# EAGLE design source_eagle (EAGLE 6.6.0)
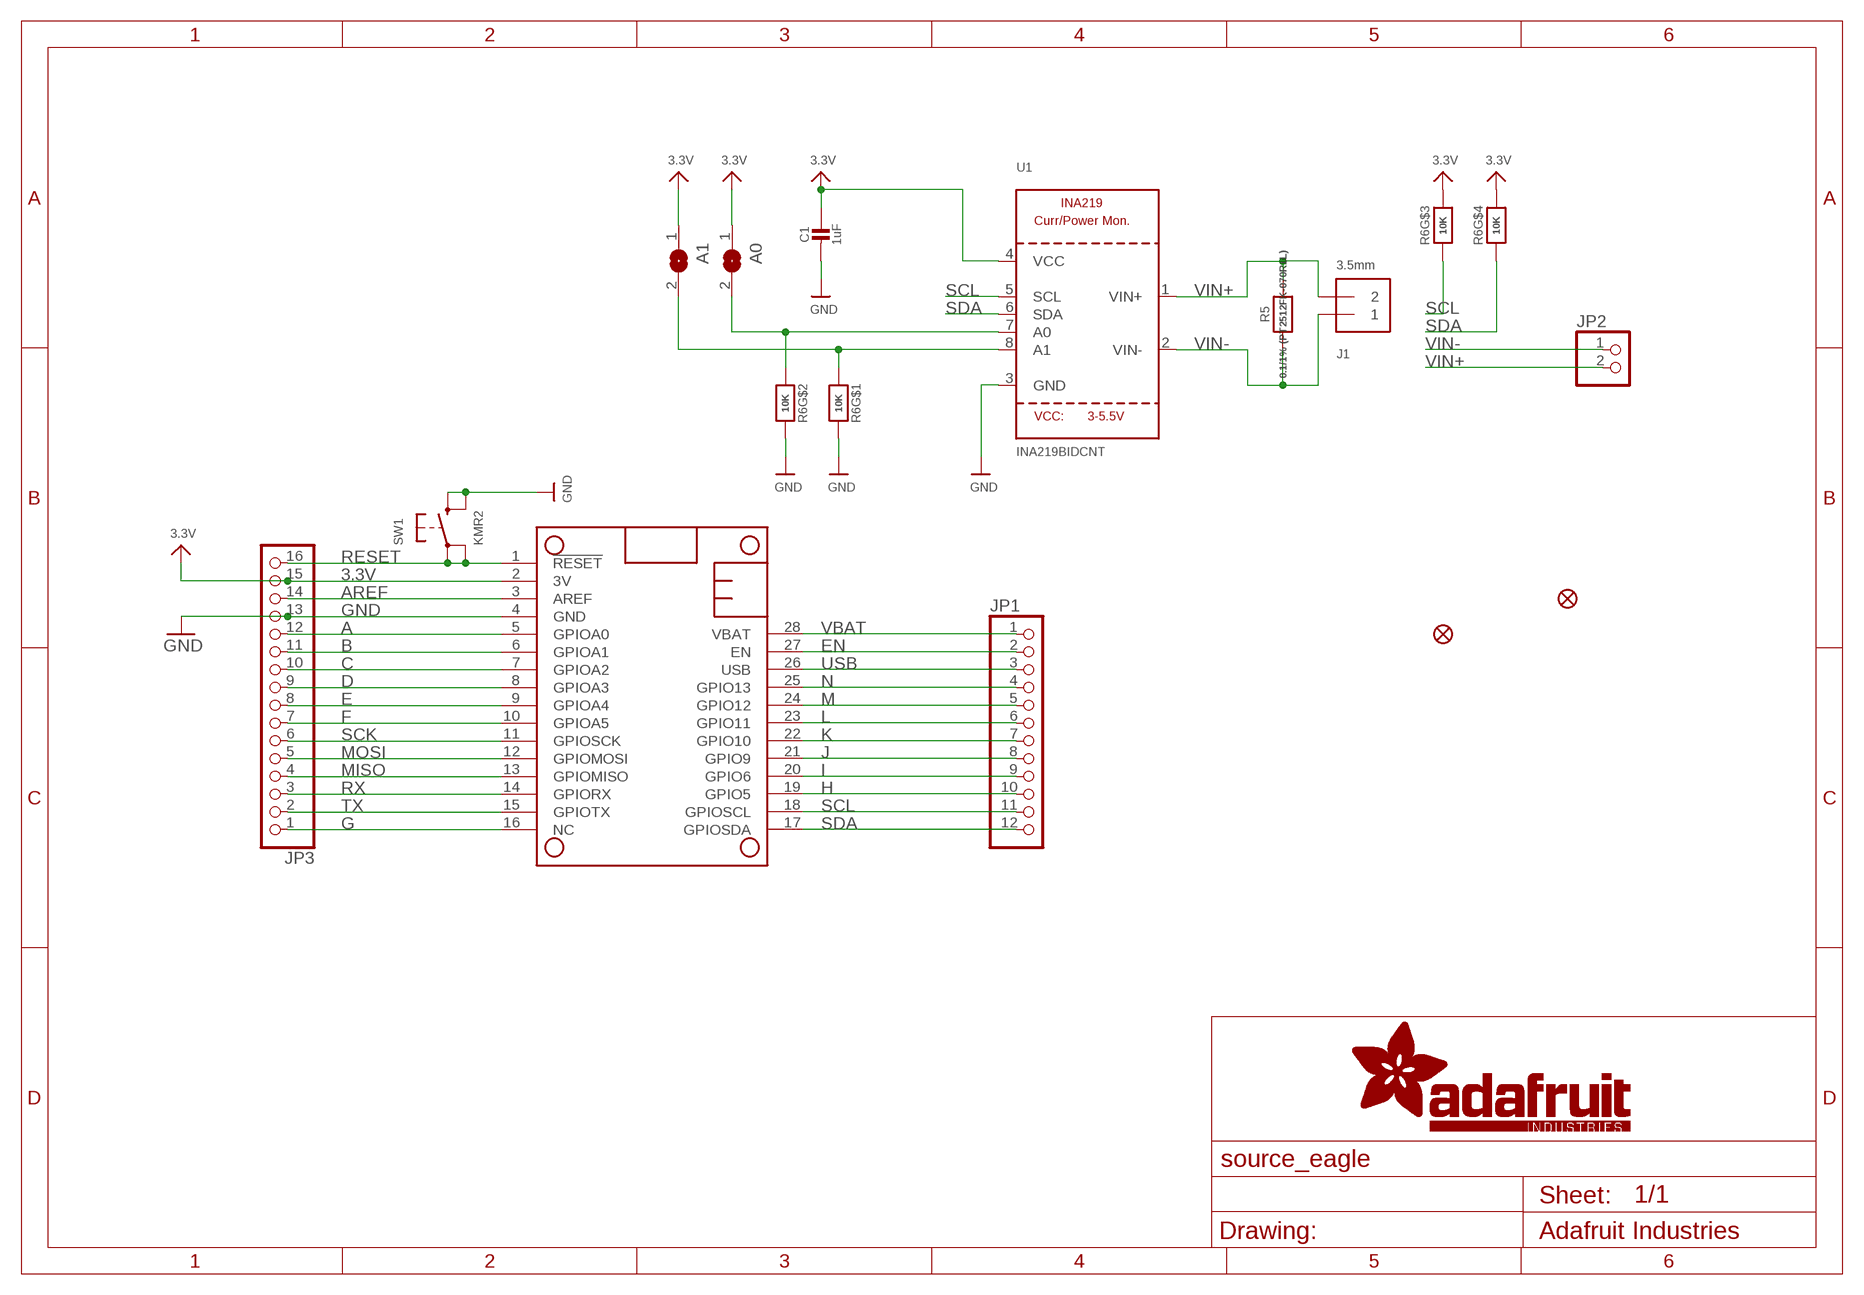
[diagram p0: schematic, sheet 1]

## Parts
A0  SOLDERJUMPERREFLOW_NOPASTE  [SOLDERJUMPER_REFLOW_NOPASTE]
A1  SOLDERJUMPERREFLOW_NOPASTE  [SOLDERJUMPER_REFLOW_NOPASTE]
C1  1uF  CAP_CERAMIC0805-NOOUTLINE  [0805-NO@1]
FID1  FIDUCIAL_1MM  [FIDUCIAL_1MM]
FID2  FIDUCIAL_1MM  [FIDUCIAL_1MM]
J1  3.5mm  TERMBLOCK_1X2  [TERMBLOCK_1X2-3.5MM]
JP1  HEADER-1X1276MIL  [1X12_ROUND_76MIL]
JP2  HEADER-1X2ROUND  [1X02_ROUND]
JP3  HEADER-1X16_76MIL  [1X16_ROUND_76MIL]
MS1  FEATHERWING  [FEATHERWING]
R5  0.1/1% (PT2512FK-070R1L)  RESISTOR2512  [2512]
R6  10K  RESISTOR_4PACK  [RESPACK_4X0603]
SW1  KMR2  SWITCH_TACT_SMT4.6X2.8  [BTN_KMR2_4.6X2.8]
U1  INA219BIDCNT  INA219  [SOT23-8]

## Nets
3.3V: A0.1 A1.1 C1.1 JP3.15 MS1.2(3V) R6.5 R6.6 U1.4(VCC)
A: JP3.12 MS1.5(GPIOA0)
AREF: JP3.14 MS1.3(AREF)
B: JP3.11 MS1.6(GPIOA1)
C: JP3.10 MS1.7(GPIOA2)
D: JP3.9 MS1.8(GPIOA3)
E: JP3.8 MS1.9(GPIOA4)
EN: JP1.2 MS1.27(EN)
F: JP3.7 MS1.10(GPIOA5)
G: JP3.1 MS1.16(NC)
GND: C1.2 JP3.13 MS1.4(GND) R6.7 R6.8 SW1.B'(S1) SW1.B(S) U1.3(GND)
H: JP1.10 MS1.19(GPIO5)
I: JP1.9 MS1.20(GPIO6)
J: JP1.8 MS1.21(GPIO9)
K: JP1.7 MS1.22(GPIO10)
L: JP1.6 MS1.23(GPIO11)
M: JP1.5 MS1.24(GPIO12)
MISO: JP3.4 MS1.13(GPIOMISO)
MOSI: JP3.5 MS1.12(GPIOMOSI)
N: JP1.4 MS1.25(GPIO13)
N$1: A1.2 R6.1 U1.8(A1)
N$2: A0.2 R6.2 U1.7(A0)
RESET: JP3.16 MS1.1(!RESET) SW1.A'(P1) SW1.A(P)
RX: JP3.3 MS1.14(GPIORX)
SCK: JP3.6 MS1.11(GPIOSCK)
SCL: JP1.11 MS1.18(GPIOSCL) R6.3 U1.5(SCL)
SDA: JP1.12 MS1.17(GPIOSDA) R6.4 U1.6(SDA)
TX: JP3.2 MS1.15(GPIOTX)
USB: JP1.3 MS1.26(USB)
VBAT: JP1.1 MS1.28(VBAT)
VIN+: J1.2 JP2.2 R5.2 U1.1(VIN+)
VIN-: J1.1 JP2.1 R5.1 U1.2(VIN-)

## Library data of the parts
A0 A1 = microbuilder:SOLDERJUMPER: SMD Solder JUMPER Solder the two pads together to create a connection, or remove the solder to break it. REFLOW - Use this footprint for solder paste and reflow ovens. WAVE - Use this footprint for hand-soldering (larger pads). CLOSED - Has a trace between the two pads to ensure it is closed by default. The trace needs to be cut to disable the jumper, and can be closed again by creating a solder bridge between the two pads.
C1 = microbuilder:CAP_CERAMIC: Ceramic Capacitors For new designs, use the packages preceded by an '_' character since they are more reliable: The following footprints should be used on most boards: _0402 - Standard footprint for regular board layouts _0603 - Standard footprint for regular board layouts _0805 - Standard footprint for regular board layouts _1206 - Standard footprint for regular board layouts For extremely tight-pitch boards where space is at a premium, the following 'micro-pitch' footprints can be used (smaller pads, no silkscreen outline, etc.): _0402MP - Micro-pitch footprint for very dense/compact boards _0603MP - Micro-pitch footprint for very dense/compact boards _0805MP - Micro-pitch footprint for very dense/compact boards _1206MP - Micro-pitch footprint for very dense/compact boards
FID1 FID2 = microbuilder:FIDUCIAL: Fiducial Alignment Points Various fiducial points for machine vision alignment.; BOM: EXCLUDE
J1 = microbuilder:TERMBLOCK_1X2: 3.5mm Terminal block http://www.ladyada.net/library/pcb/eaglelibrary.html
JP1 = microbuilder:HEADER-1X12
JP2 = microbuilder:HEADER-1X2: PIN HEADER
JP3 = microbuilder:HEADER-1X16: PIN HEADER
MS1 = microbuilder:FEATHERWING
R5 = microbuilder:RESISTOR: Resistors For new designs, use the packages preceded by an '_' character since they are more reliable: The following footprints should be used on most boards: _0402 - Standard footprint for regular board layouts _0603 - Standard footprint for regular board layouts _0805 - Standard footprint for regular board layouts _1206 - Standard footprint for regular board layouts For extremely tight-pitch boards where space is at a premium, the following 'micro-pitch' footprints can be used (smaller pads, no silkscreen outline, etc.): _0402MP - Micro-pitch footprint for very dense/compact boards _0603MP - Micro-pitch footprint for very dense/compact boards _0805MP - Micro-pitch footprint for very dense/compact boards _1206MP - Micro-pitch footprint for very dense/compact boards
R6 = microbuilder:RESISTOR_4PACK: Resistor Packs (4 resistors) 4 x 0603 10K 1/16W - Digikey: YC164J-10KCT-ND
SW1 = microbuilder:SWITCH_TACT_SMT: SMT Tact Switches 6x6mm - Digikey: P12940SCT-ND KMR2 (4.6x2.8mm) - Digikey: 401-1426-1-ND EVQ-PQHB55 - Light Touch, 160GF (4.5x4.5mm) - Digikey: P8090SCT-ND KMT0 - KMT021 NGJ LHS (etc.) IP68/Waterproof - Digikey: CKN10289CT-ND
U1 = microbuilder:INA219: INA219 - I2C Current/Power Monitor Voltage Range: 0-26V Accuracy: 0.5% Temperature: -40°C - 125°C

## Board
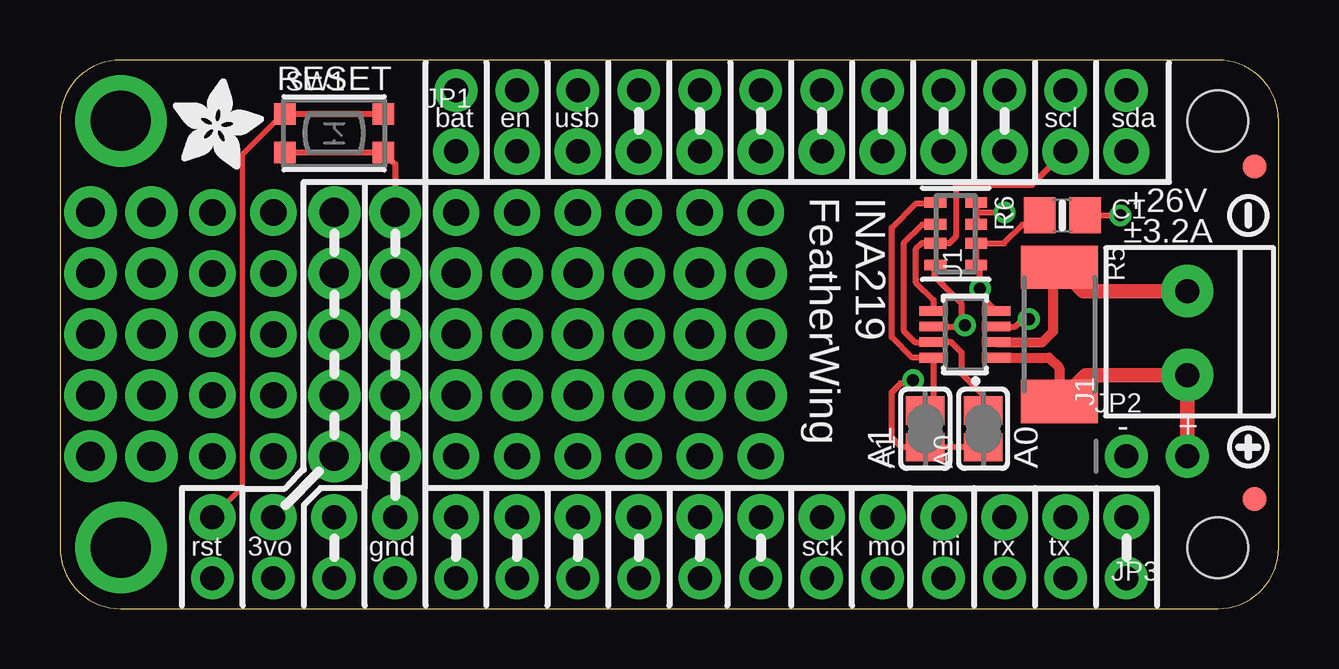
[diagram p1: board, top side]
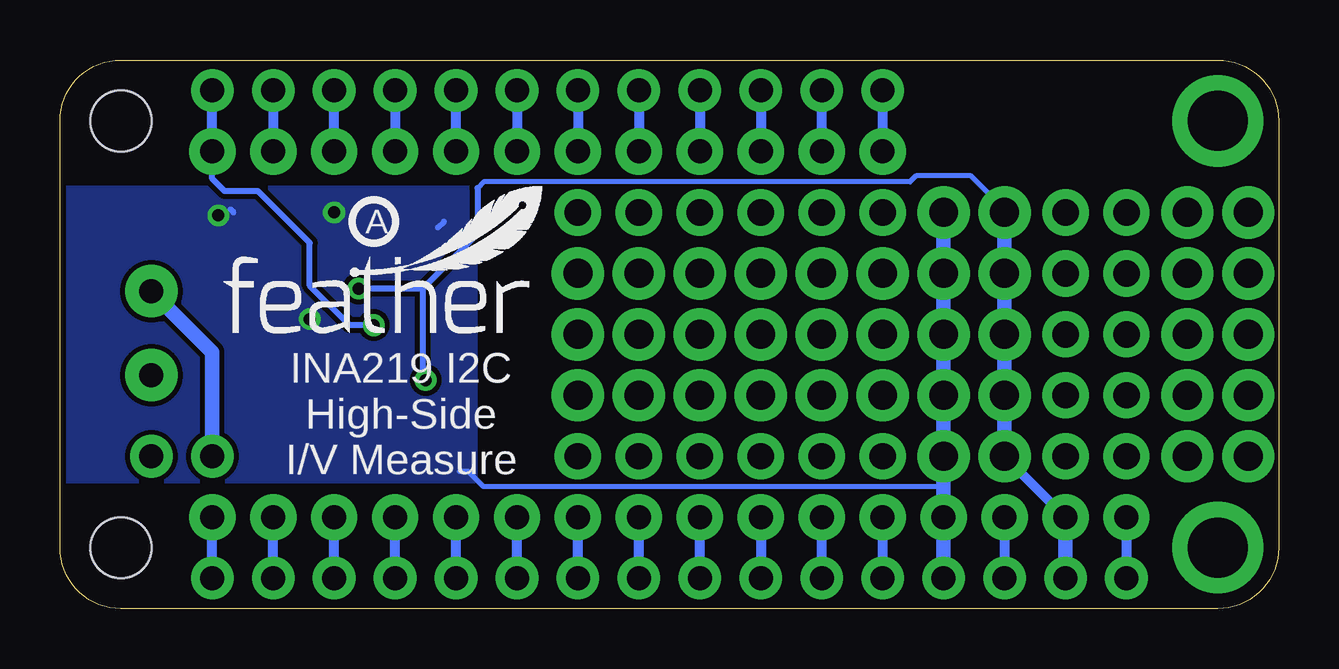
[diagram p2: board, bottom side, seen from below]

Size 50.8 x 22.86 mm. Coordinates in mm from the lower left corner, seen from the top.
Copper layers (1*16): Top 0.035mm / dielectric 1.5mm / Bottom 0.035mm
Design rules "adafruit *": minimum track width 8mil, minimum drill 15.5mil, track to track 8mil, track to pad 8mil, pad to pad 8mil, via to via 8mil, smd to smd 8mil, copper to edge 10mil, drill to drill 8mil, minimum pad ring 10mil, minimum via ring 8mil, stop-mask expansion 2mil, vias tented up to drill 20mil, thermal gap 10mil

### Footprints (pad centres in the part's own frame; a part is rotated, then mirrored left to right if it is on the bottom)
SOLDERJUMPER_REFLOW_NOPASTE = smd 1.168 x 1.6: 1 -0.762,0; 2 0.762,0
0805-NO@1 = smd 1.3 x 1.5: 1 -0.95,0; 2 0.95,0
FIDUCIAL_1MM = smd 1 x 1: 1 0,0
TERMBLOCK_1X2-3.5MM = drill 1 pad 2.184: 1 1.8,0; 2 -1.7,0
1X12_ROUND_76MIL = drill 1 pad 1.93: 1 -13.97,0; 2 -11.43,0; 3 -8.89,0; 4 -6.35,0; 5 -3.81,0; 6 -1.27,0; 7 1.27,0; 8 3.81,0; 9 6.35,0; 10 8.89,0; 11 11.43,0; 12 13.97,0
1X02_ROUND = drill 1 pad 1.778: 1 -1.27,0; 2 1.27,0
1X16_ROUND_76MIL = drill 1 pad 1.93: 1 -19.05,0; 2 -16.51,0; 3 -13.97,0; 4 -11.43,0; 5 -8.89,0; 6 -6.35,0; 7 -3.81,0; 8 -1.27,0; 9 1.27,0; 10 3.81,0; 11 6.35,0; 12 8.89,0; 13 11.43,0; 14 13.97,0; 15 16.51,0; 16 19.05,0
FEATHERWING = drill 1 pad 1.778: 1 6.35,1.27; 2 8.89,1.27; 3 11.43,1.27; 4 13.97,1.27; 5 16.51,1.27; 6 19.05,1.27; 7 21.59,1.27; 8 24.13,1.27; 9 26.67,1.27; 10 29.21,1.27; 11 31.75,1.27; 12 34.29,1.27; 13 36.83,1.27; 14 39.37,1.27; 15 41.91,1.27; 16 44.45,1.27; 17 44.45,21.59; 18 41.91,21.59; 19 39.37,21.59; 20 36.83,21.59; 21 34.29,21.59; 22 31.75,21.59; 23 29.21,21.59; 24 26.67,21.59; 25 24.13,21.59; 26 21.59,21.59; 27 19.05,21.59; 28 16.51,21.59 | drill 2.5 pad 3.81: P$1 2.54,20.32; P$2 2.54,2.54 | hole 2.54: 48.26,20.32; 48.26,2.54
2512 = smd 1.8 x 3.2: 1 -2.8,0; 2 2.8,0
RESPACK_4X0603 = smd 0.45 x 0.9: 1 -1.3,-0.85; 2 -0.4,-0.85; 3 0.4,-0.85; 4 1.3,-0.85; 5 1.3,0.85; 6 0.4,0.85; 7 -0.4,0.85; 8 -1.3,0.85
BTN_KMR2_4.6X2.8 = smd 0.9 x 0.9: A 2.05,0.8; A' -2.05,0.8; B 2.05,-0.8; B' -2.05,-0.8
SOT23-8 = smd 0.4 x 1.2: 1 -0.975,-1.3; 2 -0.325,-1.3; 3 0.325,-1.3; 4 0.975,-1.3; 5 0.975,1.3; 6 0.325,1.3; 7 -0.325,1.3; 8 -0.975,1.3

### Placement (x,y rotation side)
A0  38.48,7.49 90 top
A1  36.07,7.49 90 top
C1  41.78,16.38 0 top
FID1  49.78,4.57 0 top
FID2  49.78,18.41 0 top
J1  46.99,11.43 90 top
JP1  30.48,19.05 0 top
JP2  45.72,6.35 0 top
JP3  25.4,3.81 180 top
MS1  0,0 0 top
R5  41.66,11.43 270 top
R6  37.34,15.62 270 top
SW1  11.43,19.81 0 top
U1  37.72,11.43 90 top
U$12  [SYMBOL_PLUS]  49.53,6.73 0 top
U$13  [SYMBOL_MINUS]  49.53,16.38 90 top
U$15  [FEATHERLOGO_SMALL]  44.07,11.43 0 bottom
U$16  [ADAFRUIT_3.5MM]  4.7,18.29 0 top
U$17  [PCBFEAT-REV-040]  37.72,16.13 0 bottom

### Tracks (layer width: path | path; a pad name or v marks a point on that pad's centre or on a via)
3.3V  (via drill 0.5, 1.2 pad 2.18)
  Top 0.254: A0.1 A1.1 35.05,6.73 34.67,7.11 34.67,9.02 35.05,9.4 35.43,9.4 v35.56,9.53 | U1.4 38.44,12.98 38.44,13.34 v38.35,13.34 38.35,14.15 R6.5 R6.6 39.35,15.22 40.13,16 40.45,16 C1.1
  Bottom 0.203: 11.43,16.64 12.83,18.03 15.11,18.03 15.37,17.78 33.15,17.78 33.4,17.53
  Bottom 0.254: 35.69,13.34 v38.35,13.34 | 33.4,17.53 33.4,15.62 35.69,13.34 | 35.69,13.34 35.69,9.65 v35.56,9.53
  Bottom 0.406: JP3.15 v11.43,6.35
  Bottom 0.61: JP3.15 MS1.2 | 11.43,16.64 v11.43,16.51 v11.43,13.97 v11.43,11.43 v11.43,8.89 v11.43,6.35
A
  Bottom 0.406: JP3.12 MS1.5
AREF
  Bottom 0.406: JP3.14 MS1.3
B
  Bottom 0.406: MS1.6 JP3.11
C
  Bottom 0.406: JP3.10 MS1.7
D
  Bottom 0.406: MS1.8 JP3.9
E
  Bottom 0.406: MS1.9 JP3.8
EN
  Bottom 0.406: JP1.2 MS1.27
F
  Bottom 0.406: MS1.10 JP3.7
G
  Bottom 0.406: MS1.16 JP3.1
GND  (via drill 0.5, 1.2 pad 2.18)
  Top 0.254: U1.3 39.82,11.76 40.26,12.19 v40.39,12.06 | C1.2 v44.2,16.38 | SW1.B' SW1.B 13.97,18.52 v13.97,16.51 | R6.8 38.19,16.47 | 38.19,16.47 R6.7 | 38.19,16.47 38.23,16.51 v39.37,16.51
  Bottom 0.203: 13.97,4.83 14.22,5.08 33.15,5.08 33.78,5.71 34.16,5.71
  Bottom 0.254: 43.56,16.51 43.69,16.64 | 34.8,16.13 35.05,15.88 | v39.37,16.51 39.37,16.26
  Bottom 0.61: v13.97,16.51 v13.97,13.97 v13.97,11.43 v13.97,8.89 v13.97,6.35 13.97,4.83 JP3.13 MS1.4
  pour Bottom: 33.53,17.53 33.53,5.33 50.55,5.33 50.55,17.53
H
  Bottom 0.406: JP1.10 MS1.19
I
  Bottom 0.406: MS1.20 JP1.9
J
  Bottom 0.406: JP1.8 MS1.21
K
  Bottom 0.406: MS1.22 JP1.7
L
  Bottom 0.406: MS1.23 JP1.6
M
  Bottom 0.406: MS1.24 JP1.5
MISO
  Bottom 0.406: MS1.13 JP3.4
MOSI
  Bottom 0.406: MS1.12 JP3.5
N
  Bottom 0.406: MS1.25 JP1.4
N$1
  Top 0.254: A1.2 36.42,8.61 U1.8 35.52,10.46 34.67,11.3 34.67,15.88 35.69,16.89 36.46,16.89 R6.1
N$2
  Top 0.254: 38.9,8.26 A0.2 38.48,8.89 37.59,9.78 37.59,10.67 37.16,11.11 U1.7 35.63,11.11 35.18,11.56 35.18,15.24 35.94,16 36.47,16 R6.2
N$34  (via drill 1.1 pad 1.93)
  other vias: 6.35,16.51
N$35  (via drill 1.2 pad 2.18)
  other vias: 3.81,16.51
N$36  (via drill 1.2 pad 2.18)
  other vias: 1.27,16.51
N$37  (via drill 1.2 pad 2.18)
  other vias: 1.27,13.97
N$38  (via drill 1.2 pad 2.18)
  other vias: 3.81,13.97
N$39  (via drill 1.1 pad 1.93)
  other vias: 6.35,13.97
N$40  (via drill 1.1 pad 1.93)
  other vias: 6.35,11.43
N$41  (via drill 1.2 pad 2.18)
  other vias: 3.81,11.43
N$42  (via drill 1.2 pad 2.18)
  other vias: 1.27,11.43
N$43  (via drill 1.2 pad 2.18)
  other vias: 1.27,8.89
N$44  (via drill 1.2 pad 2.18)
  other vias: 3.81,8.89
N$45  (via drill 1.1 pad 1.93)
  other vias: 6.35,8.89
N$46  (via drill 1.1 pad 1.93)
  other vias: 6.35,6.35
N$47  (via drill 1.2 pad 2.18)
  other vias: 3.81,6.35
N$48  (via drill 1.2 pad 2.18)
  other vias: 1.27,6.35
N$49  (via drill 1.1 pad 1.93)
  other vias: 8.89,6.35
N$50  (via drill 1.1 pad 1.93)
  other vias: 8.89,8.89
N$51  (via drill 1.1 pad 1.93)
  other vias: 8.89,11.43
N$52  (via drill 1.1 pad 1.93)
  other vias: 8.89,13.97
N$53  (via drill 1.1 pad 1.93)
  other vias: 8.89,16.51
N$64  (via drill 1.1 pad 1.93)
  other vias: 16.51,16.51
N$65  (via drill 1.1 pad 1.93)
  other vias: 19.05,16.51
N$66  (via drill 1.1 pad 1.93)
  other vias: 21.59,16.51
N$67  (via drill 1.2 pad 2.18)
  other vias: 16.51,13.97
N$68  (via drill 1.2 pad 2.18)
  other vias: 16.51,11.43
N$69  (via drill 1.2 pad 2.18)
  other vias: 16.51,8.89
N$70  (via drill 1.1 pad 1.93)
  other vias: 16.51,6.35
N$71  (via drill 1.1 pad 1.93)
  other vias: 19.05,6.35
N$72  (via drill 1.2 pad 2.18)
  other vias: 19.05,8.89
N$73  (via drill 1.2 pad 2.18)
  other vias: 19.05,11.43
N$74  (via drill 1.2 pad 2.18)
  other vias: 19.05,13.97
N$75  (via drill 1.2 pad 2.18)
  other vias: 21.59,13.97
N$76  (via drill 1.2 pad 2.18)
  other vias: 21.59,11.43
N$77  (via drill 1.2 pad 2.18)
  other vias: 21.59,8.89
N$78  (via drill 1.1 pad 1.93)
  other vias: 21.59,6.35
N$79  (via drill 1.1 pad 1.93)
  other vias: 24.13,6.35
N$80  (via drill 1.2 pad 2.18)
  other vias: 24.13,8.89
N$81  (via drill 1.1 pad 1.93)
  other vias: 24.13,16.51
N$82  (via drill 1.2 pad 2.18)
  other vias: 24.13,13.97
N$83  (via drill 1.2 pad 2.18)
  other vias: 24.13,11.43
N$84  (via drill 1.1 pad 1.93)
  other vias: 26.67,6.35
N$85  (via drill 1.2 pad 2.18)
  other vias: 26.67,8.89
N$86  (via drill 1.2 pad 2.18)
  other vias: 26.67,11.43
N$87  (via drill 1.2 pad 2.18)
  other vias: 26.67,13.97
N$88  (via drill 1.1 pad 1.93)
  other vias: 26.67,16.51
N$89  (via drill 1.1 pad 1.93)
  other vias: 29.21,16.51
N$90  (via drill 1.2 pad 2.18)
  other vias: 29.21,13.97
N$91  (via drill 1.2 pad 2.18)
  other vias: 29.21,11.43
N$92  (via drill 1.2 pad 2.18)
  other vias: 29.21,8.89
N$93  (via drill 1.1 pad 1.93)
  other vias: 29.21,6.35
RESET
  Top 0.203: JP3.16 7.62,5.08 7.62,18.92 9.31,20.61 SW1.A'
  Top 0.254: SW1.A' SW1.A
  Bottom 0.406: JP3.16 MS1.1
RX
  Bottom 0.406: MS1.14 JP3.3
SCK
  Bottom 0.406: MS1.11 JP3.6
SCL
  Top 0.254: U1.5 36.42,12.86 35.69,13.59 35.69,14.99 35.94,15.24 36.47,15.24 R6.3 37.06,15.22 37.34,15.49 37.34,17.65 40.51,17.65 JP1.11
  Bottom 0.406: MS1.18 JP1.11
SDA  (via drill 0.5)
  Top 0.254: U1.6 37.41,11.76 37.59,11.94 | 37.59,11.94 37.59,12.7 36.45,13.84 36.45,14.19 36.49,14.22 R6.4 | 37.59,11.94 v37.72,11.81
  Bottom 0.254: v37.72,11.81 38.73,11.81 40.39,13.46 40.39,15.24 42.55,17.4 43.94,17.4 44.45,17.91 JP1.12
  Bottom 0.406: JP1.12 MS1.17
TX
  Bottom 0.406: MS1.15 JP3.2
USB
  Bottom 0.406: MS1.26 JP1.3
VBAT
  Bottom 0.406: MS1.28 JP1.1
VIN+
  Top 0.406: U1.1 41.23,10.46 41.66,10.03 R5.2
  Top 0.61: R5.2 42.76,9.73 J1.2 JP2.2
VIN-
  Top 0.406: U1.2 40.95,11.11 41.4,11.56 41.4,13.98 R5.1
  Top 0.61: R5.1 42.66,13.23 J1.1
  Bottom 0.61: JP2.1 44.45,10.69 J1.1

### Text on the board
tPlace: RESET | bat | en | usb | scl | sda | INA219 / FeatherWing | +26V | ±3.2A | - | + | A1 | A0 | rst | 3vo | gnd | sck | mo | mi | rx | tx
bPlace: INA219 I2C / High-Side / I/V Measure